# EAGLE design LocoNet-DCC Interface v3.0 (EAGLE 9.6.2)
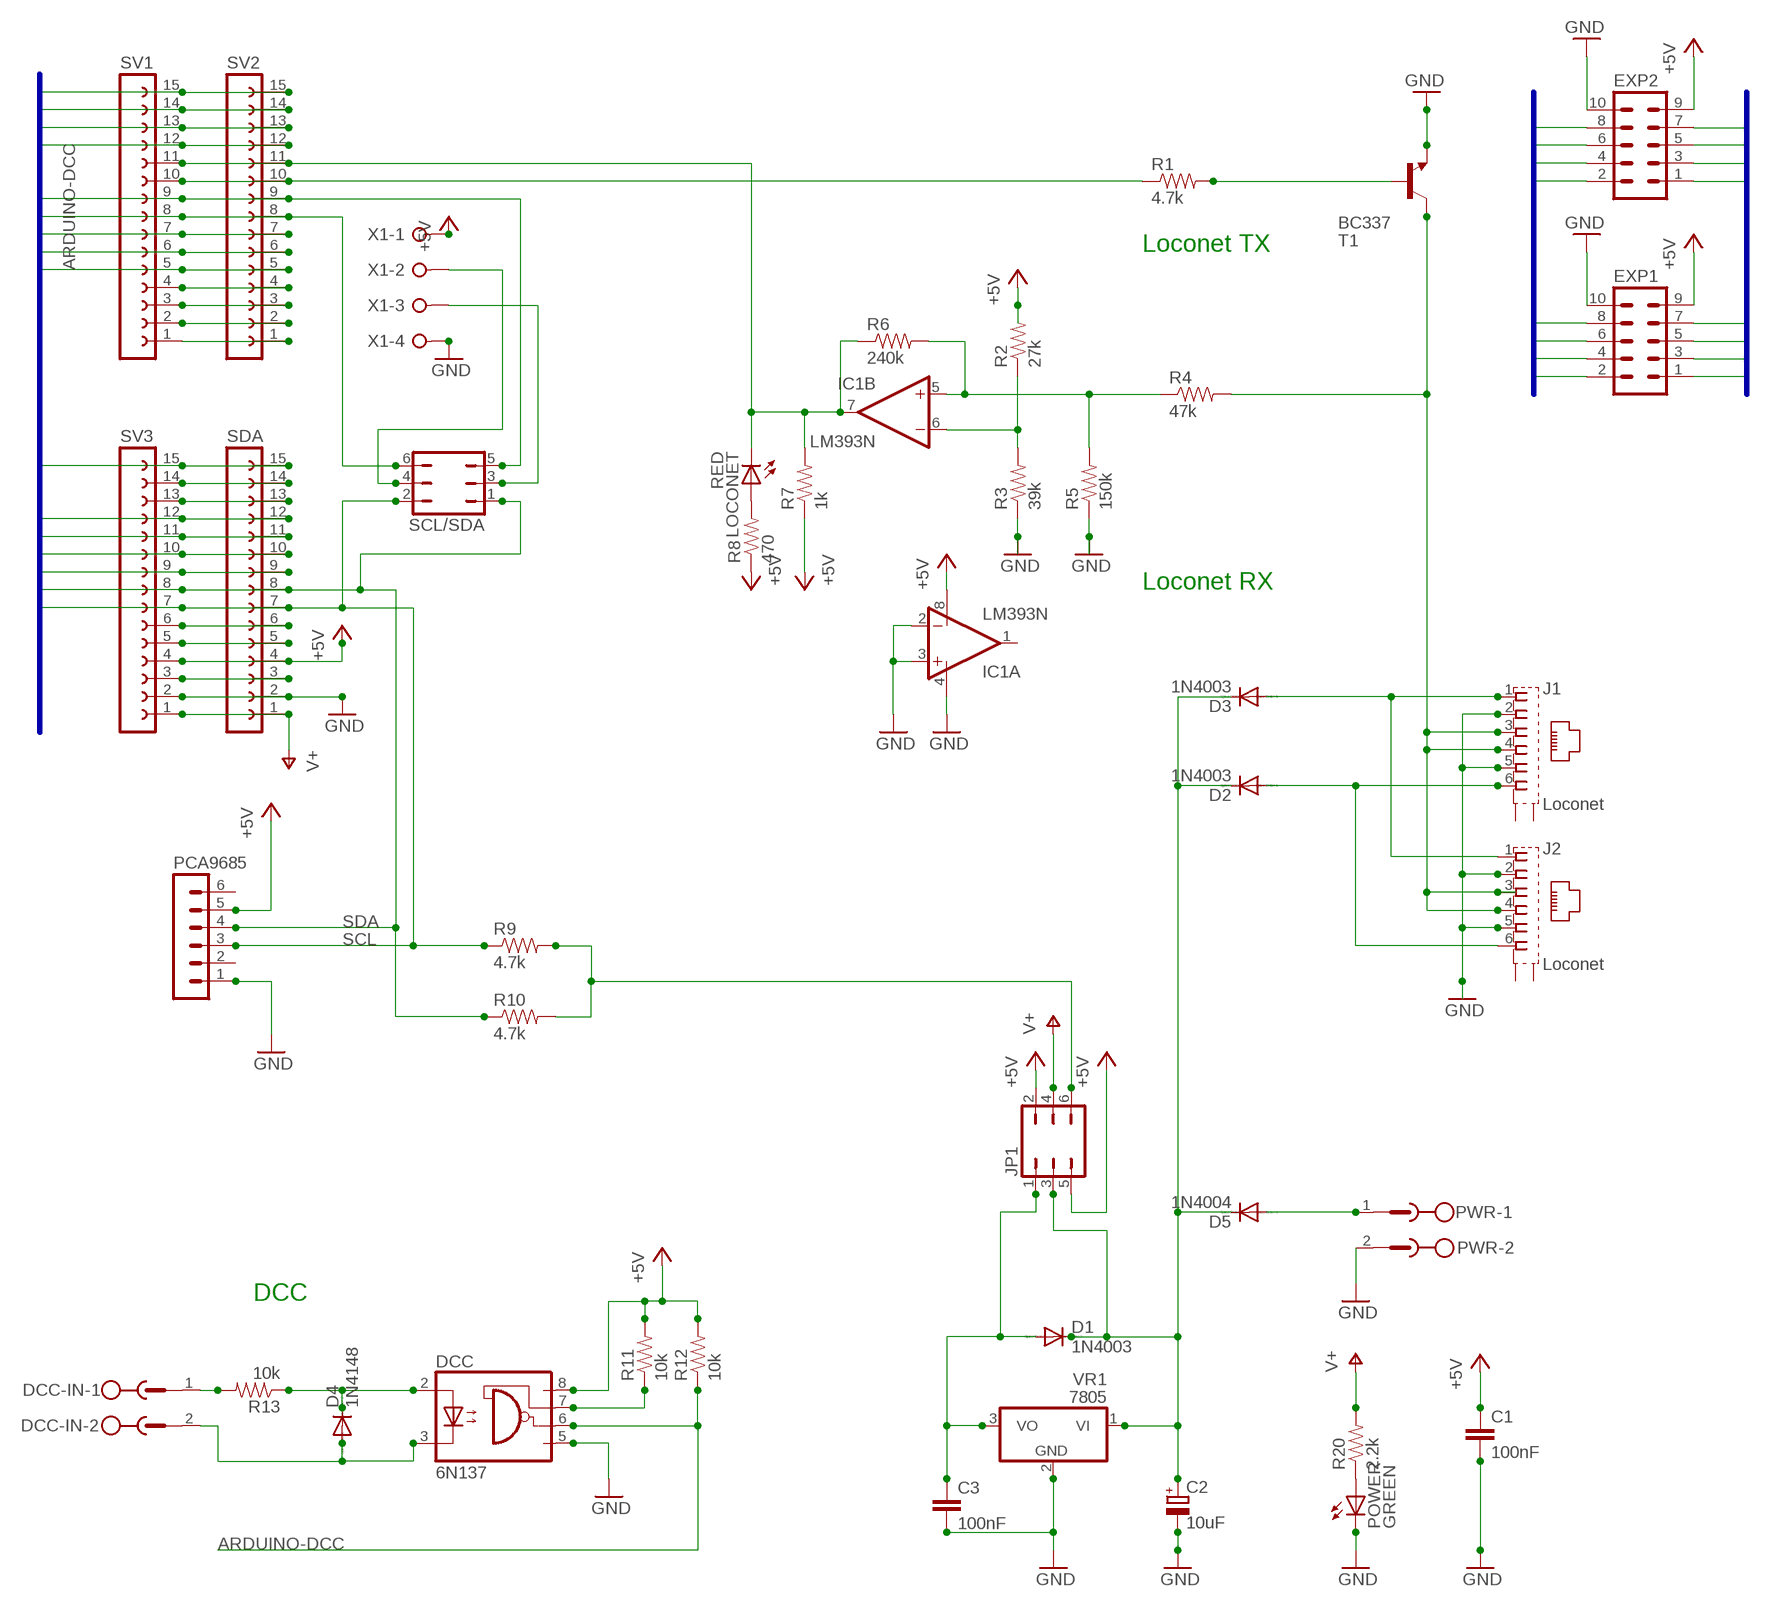
[diagram p0: schematic, sheet 1]

## Parts
C1  100nF  C-EU025_050-025X075  [C025_050-025X075]
C2  10uF  CPOL-EUE2.5-6  [E2,5-6]
C3  100nF  C-EU025_050-025X075  [C025_050-025X075]
D1  1N4003  1N4004  [DO41-10]
D2  1N4003  1N4004  [DO41-10]
D3  1N4003  1N4004  [DO41-10]
D4  1N4148  1N4148DO35-7  [DO35-7]
D5  1N4004  [DO41-10]
DCC  6N137  [DIL08]
DCC-IN  2EDG-02  [2EDG-02]
EXP1  ML10  [ML10]
EXP2  ML10  [ML10]
IC1  LM393N  [DIL08]
J1  Loconet  555140-1  [555140-1]
J2  Loconet  555140-1  [555140-1]
JP1  JP3Q  [JP3Q]
LOCONET  RED  LED3MM  [LED3MM]
PCA9685  MA06-1  [MA06-1]
POWER  GREEN  LED3MM  [LED3MM]
PWR  2EDG-02  [2EDG-02]
R1  4.7k  RESISTORAXIAL-0.3  [AXIAL-0.3]
R2  27k  RESISTORAXIAL-0.3  [AXIAL-0.3]
R3  39k  RESISTORAXIAL-0.3  [AXIAL-0.3]
R4  47k  RESISTORAXIAL-0.3  [AXIAL-0.3]
R5  150k  RESISTORAXIAL-0.3  [AXIAL-0.3]
R6  240k  RESISTORAXIAL-0.3  [AXIAL-0.3]
R7  1k  RESISTORAXIAL-0.3  [AXIAL-0.3]
R8  470  RESISTORAXIAL-0.3  [AXIAL-0.3]
R9  4.7k  RESISTORAXIAL-0.3  [AXIAL-0.3]
R10  4.7k  RESISTORAXIAL-0.3  [AXIAL-0.3]
R11  10k  RESISTORAXIAL-0.3  [AXIAL-0.3]
R12  10k  RESISTORAXIAL-0.3  [AXIAL-0.3]
R13  10k  RESISTORAXIAL-0.3  [AXIAL-0.3]
R20  2.2k  RESISTORAXIAL-0.3  [AXIAL-0.3]
SCL/SDA  JP3Q  [JP3Q]
SDA  FE15-1NOTEXT  [FE15]
SV1  FE15-1NOTEXT  [FE15]
SV2  FE15-1NOTEXT  [FE15]
SV3  FE15-1NOTEXT  [FE15]
T1  BC337  [TO92]
VR1  7805  7805TV  [TO220V]
X1  W237-04P  [W237-4P]

## Nets
3V3: SDA.14 SV3.14
+5V [5v]: C1.1 DCC.8(VCC) EXP1.9 EXP2.9 IC1.8(P:V+) JP1.2 JP1.5 PCA9685.5 R2.P$2 R7.P$1 R8.P$1 R11.P$2 R12.P$2 SDA.4 SV3.4 X1.1
A0: EXP2.3 SDA.12 SV3.12
A1: EXP2.4 SDA.11 SV3.11
A2: EXP2.5 SDA.10 SV3.10
A3: EXP2.6 SDA.9 SV3.9
A6: SDA.6 SV3.6
A7: SDA.5 SV3.5
ARDUINO-DCC: DCC.6(VO) EXP1.1 R12.P$1 SV1.5 SV2.5
AREF: SDA.13 SV3.13
GND [ground]: C1.2 C2.- C3.2 DCC.5(GND) EXP1.10 EXP2.10 IC1.2(A:-IN) IC1.3(A:+IN) IC1.4(P:V-) J1.2 J1.5 J2.2 J2.5 PCA9685.1 POWER.K(C) PWR.2 R3.P$1 R5.P$1 SDA.2 SV3.2 T1.1(E) VR1.2(GND) X1.4
I2C_PULLUP: JP1.6 R9.P$2 R10.P$2
L-RX: IC1.7(B:OUT) LOCONET.K(C) R6.P$1 R7.P$2 SV1.11 SV2.11
L-TX: R1.P$1 SV1.10 SV2.10
LOCONET-SIGNAL [Loconet]: J1.3 J1.4 J2.3 J2.4 R4.P$2 T1.3(C)
N$5: POWER.A R20.P$1
N$7: LOCONET.A R8.P$2
N$8: R1.P$2 T1.2(B)
N$10: IC1.6(B:-IN) R2.P$1 R3.P$2
N$11: IC1.5(B:+IN) R4.P$1 R5.P$2 R6.P$2
N$14: SDA.3 SV3.3
N$30: SV1.4 SV2.4
N$37 [DCC]: D4.C DCC.2(A) R13.P$1
N$42 [DCC]: D4.A DCC-IN.2 DCC.3(C)
N$43: DCC.7(VE) R11.P$1
N$45 [DCC]: DCC-IN.1 R13.P$2
PIN3: EXP1.2 SV1.6 SV2.6
PIN4: EXP1.3 SV1.7 SV2.7
PIN5: EXP1.4 SCL/SDA.6 SV1.8 SV2.8
PIN6: EXP1.5 SCL/SDA.5 SV1.9 SV2.9
PIN9: EXP1.6 SV1.12 SV2.12
PIN10: EXP1.7 SV1.13 SV2.13
PIN11: EXP1.8 SV1.14 SV2.14
PIN12: EXP2.1 SV1.15 SV2.15
PIN13: EXP2.2 SDA.15 SV3.15
PWR-IN [Vin]: D5.A PWR.1
RAILSYNC-A [Vin]: D3.A J1.1 J2.1
RAILSYNC-B [Vin]: D2.A J1.6 J2.6
RAILSYNC-VIN [Vin]: C2.+ D1.C D2.C D3.C D5.C JP1.3 VR1.1(VI)
RESET: SV1.3 SV2.3
RXD: SV1.2 SV2.2
SCL: EXP2.8 PCA9685.3 R9.P$1 SCL/SDA.2 SDA.7 SV3.7
SDA: EXP2.7 PCA9685.4 R10.P$1 SCL/SDA.1 SDA.8 SV3.8
TXD: SV1.1 SV2.1
V-OUT [5v]: C3.1 D1.A JP1.1 VR1.3(VO)
VIN [Vin]: JP1.4 R20.P$2 SDA.1 SV3.1 ; supply symbol labelled V+
X1-SCL/D5: SCL/SDA.4 X1.2
X1-SDA/D6: SCL/SDA.3 X1.3
Unconnected: IC1.1(A:OUT) J1.G1(S1) J1.G2(S2) J2.G1(S1) J2.G2(S2) PCA9685.2 PCA9685.6

## Buses
EXPANSION:A0,A1,A2,A3,ARDUINO-DCC,PIN3,PIN4,PIN5,PIN6,PIN9,PIN10,PIN11,PIN12,PIN13,SCL,SDA

## Notes on the sheet
- Loconet TX
- Loconet RX
- DCC

## Library data of the parts
C1 C3 = rcl:C-EU: CAPACITOR, European symbol
C2 = rcl:CPOL-EU: POLARIZED CAPACITOR, European symbol
D1-D3 D5 = diode:1N4004: DIODE general purpose rectifier, 1 A
D4 = diode:1N4148: DIODE high speed (Philips)
DCC = optocoupler:6N137: MOTOROLA OPTO COUPLER; MPN: 6N137; OC_FARNELL: 1328376; OC_NEWARK: 52M1895
DCC-IN PWR = 2EDG Connectors 5.08mm - Full Silkscreen on PCB v1-0:2EDG-02: 2EDG Connectors Rembrandt Electronics
EXP1 EXP2 = con-ml:ML10: HARTING; OC_FARNELL: unknown; OC_NEWARK: unknown
IC1 = linear:LM393: COMPARATOR
J1 J2 = con-amp:555140-1: AMP connector
JP1 SCL/SDA = jumper:JP3Q: JUMPER
LOCONET POWER = led:LED: LED OSRAM: - CHIPLED LG R971, LG N971, LY N971, LG Q971, LY Q971, LO R971, LY R971 LH N974, LH R974 LS Q976, LO Q976, LY Q976 LO Q996 - Hyper CHIPLED LW Q18S LB Q993, LB Q99A, LB R99A - SideLED LS A670, LO A670, LY A670, LG A670, LP A670 LB A673, LV A673, LT A673, LW A673 LH A674 LY A675 LS A676, LA A676, LO A676, LY A676, LW A676 LS A679, LY A679, LG A679 - Hyper Micro SIDELED® LS Y876, LA Y876, LO Y876, LY Y876 LT Y87S - SmartLED LW L88C, LW L88S LB L89C, LB L89S, LG L890 LS L89K, LO L89K, LY L89K LS L896, LA L896, LO L896, LY L896 - TOPLED LS T670, LO T670, LY T670, LG T670, LP T670 LSG T670, LSP T670, LSY T670, LOP T670, LYG T670 LG T671, LOG T671, LSG T671 LB T673, LV T673, LT T673, LW T673 LH T674 LS T676, LA T676, LO T676, LY T676, LB T676, LH T676, LSB T676, LW T676 LB T67C, LV T67C, LT T67C, LS T67K, LO T67K, LY T67K, LW E67C LS E67B, LA E67B, LO E67B, LY E67B, LB E67C, LV E67C, LT E67C LW T67C LS T679, LY T679, LG T679 LS T770, LO T770, LY T770, LG T770, LP T770 LB T773, LV T773, LT T773, LW T773 LH T774 LS E675, LA E675, LY E675, LS T675 LS T776, LA T776, LO T776, LY T776, LB T776 LHGB T686 LT T68C, LB T68C - Hyper Mini TOPLED® LB M676 - Mini TOPLED Santana® LG M470 LS M47K, LO M47K, LY M47K Source: http://www.osram.convergy.de LUXEON: - LUMILED® LXK2-PW12-R00, LXK2-PW12-S00, LXK2-PW14-U00, LXK2-PW14-V00 LXK2-PM12-R00, LXK2-PM12-S00, LXK2-PM14-U00 LXK2-PE12-Q00, LXK2-PE12-R00, LXK2-PE12-S00, LXK2-PE14-T00, LXK2-PE14-U00 LXK2-PB12-K00, LXK2-PB12-L00, LXK2-PB12-M00, LXK2-PB14-N00, LXK2-PB14-P00, LXK2-PB14-Q00 LXK2-PR12-L00, LXK2-PR12-M00, LXK2-PR14-Q00, LXK2-PR14-R00 LXK2-PD12-Q00, LXK2-PD12-R00, LXK2-PD12-S00 LXK2-PH12-R00, LXK2-PH12-S00 LXK2-PL12-P00, LXK2-PL12-Q00, LXK2-PL12-R00 Source: www.luxeon.com KINGBRIGHT: KA-3528ASYC Source: www.kingbright.com
PCA9685 = con-lstb:MA06-1: PIN HEADER; OC_FARNELL: unknown; OC_NEWARK: unknown
R1-R13 R20 = SparkFun-Resistors:RESISTOR: Resistor Basic schematic elements and footprints for 0603, 1206, and PTH resistors.
SDA SV1-SV3 = con-lsta:FE15-1: FEMALE HEADER
T1 = transistor:BC337: NPN TRANSISTOR
VR1 = linear:78*: Positive VOLTAGE REGULATOR Source: http://cache.national.com/ds/LM/LM78L05.pdf http://www.fairchildsemi.com/ds/LM/LM7805.pdf
X1 = con-wago-508:W237-04P: WAGO SREW CLAMP; OC_FARNELL: unknown; OC_NEWARK: unknown

## Net classes
0 default: width 0.254 mm
1 ground: width 0.61 mm
2 5v: width 0.508 mm
3 Vin: width 0.61 mm
4 Loconet: width 0.508 mm
5 DCC: width 0.508 mm

## Board
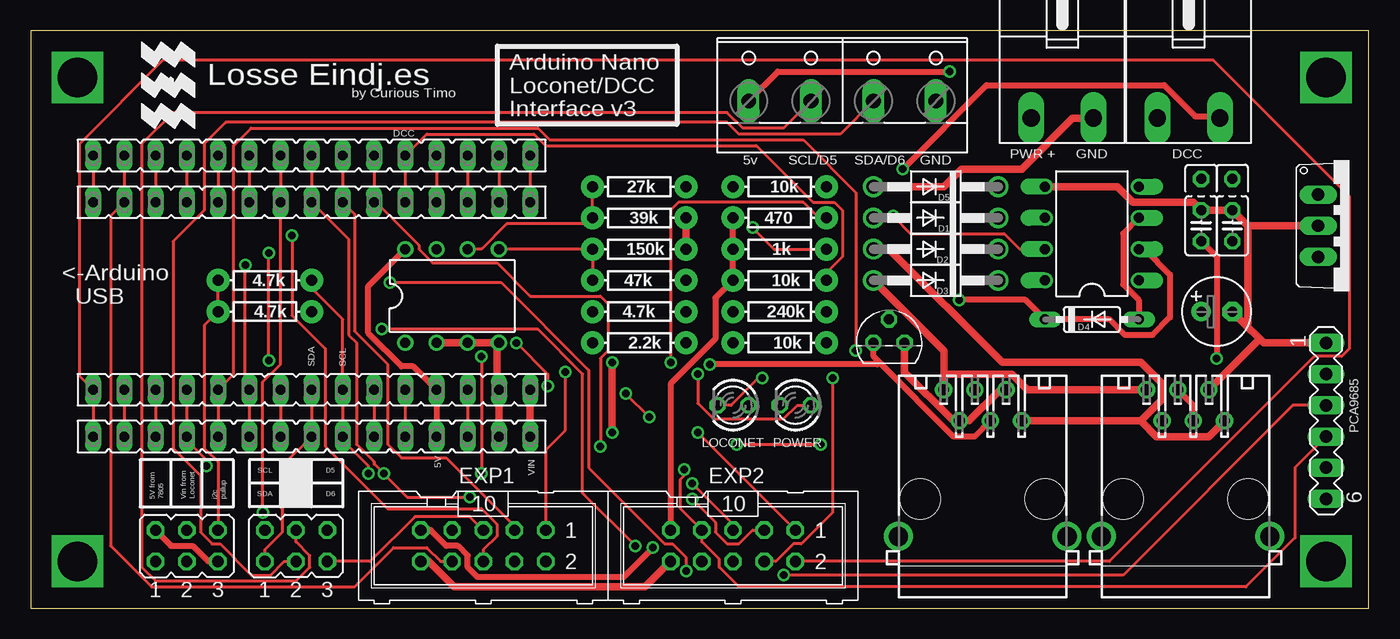
[diagram p1: board, top side]
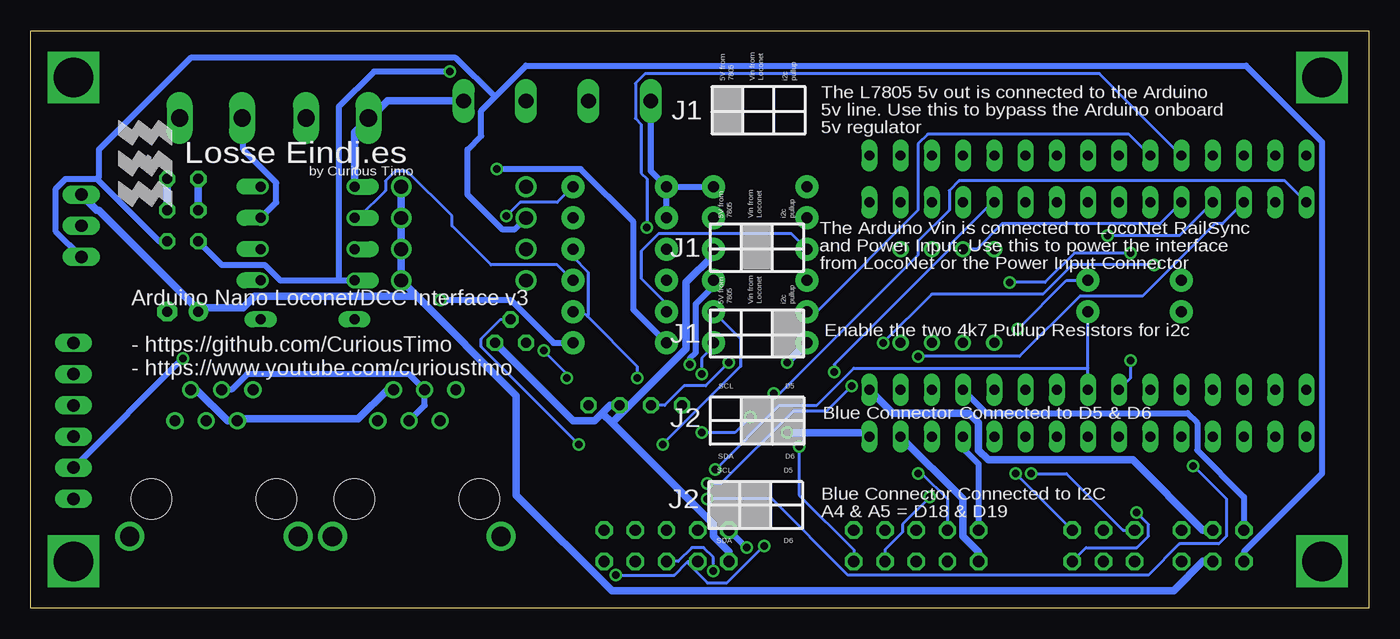
[diagram p2: board, bottom side, seen from below]

Size 108.89 x 46.98 mm. Coordinates in mm from the lower left corner, seen from the top.
Outline: 0,0 108.89,0 108.89,46.98 0,46.98 0,0
Copper layers (1*16): Top 0.035mm / dielectric 1.5mm / Bottom 0.035mm
Design rules "default": minimum track width 10mil, minimum drill 24mil, track to track 8mil, track to pad 8mil, pad to pad 8mil, via to via 8mil, smd to smd 8mil, copper to edge 40mil, drill to drill 8mil, minimum pad ring 10mil, minimum via ring 8mil, stop-mask expansion 4mil, vias tented up to drill 0mil, thermal gap 10mil

### Footprints (pad centres in the part's own frame; a part is rotated, then mirrored left to right if it is on the bottom)
C025_050-025X075 = drill 0.813 octagon: 1 -1.27,0; 2 1.27,0; 3 3.81,0
E2,5-6 = drill 0.813 pad 1.6: + -1.27,0 | drill 0.813 pad 1.6 octagon: - 1.27,0
DO41-10 = drill 1.118: A 5.08,0; C -5.08,0
DO35-7 = drill 0.813 long: A 3.81,0; C -3.81,0
DIL08 = drill 0.813 offset: 1 -3.81,-3.81; 2 -1.27,-3.81; 3 1.27,-3.81; 4 3.81,-3.81; 5 3.81,3.81; 6 1.27,3.81; 7 -1.27,3.81; 8 -3.81,3.81
2EDG-02 = drill 1.397 long: 1 -2.54,7.62; 2 2.54,7.62
ML10 = drill 0.914 octagon: 1 -5.08,-1.27; 2 -5.08,1.27; 3 -2.54,-1.27; 4 -2.54,1.27; 5 0,-1.27; 6 0,1.27; 7 2.54,-1.27; 8 2.54,1.27; 9 5.08,-1.27; 10 5.08,1.27
DIL08' = drill 0.813 pad 1.27: 1 -3.81,-3.81; 2 -1.27,-3.81; 3 1.27,-3.81; 4 3.81,-3.81; 5 3.81,3.81; 6 1.27,3.81; 7 -1.27,3.81; 8 -3.81,3.81
555140-1 = drill 0.889: 1 -3.175,8.89; 2 -1.905,6.35; 3 -0.635,8.89; 4 0.635,6.35; 5 1.905,8.89; 6 3.175,6.35 | drill 1.575 pad 2.184: G1 -6.858,-3.048; G2 6.858,-3.048 | hole 3.251: -5.08,0; 5.08,0
JP3Q = drill 0.914 octagon: 1 -2.54,-1.27; 2 -2.54,1.27; 3 0,-1.27; 4 0,1.27; 5 2.54,-1.27; 6 2.54,1.27
LED3MM = drill 0.813 octagon: A -1.27,0; K 1.27,0
MA06-1 = drill 1.016 long: 1 -6.35,0; 2 -3.81,0; 3 -1.27,0; 4 1.27,0; 5 3.81,0; 6 6.35,0
AXIAL-0.3 = drill 0.9 pad 1.88: P$1 -3.81,0; P$2 3.81,0
FE15 = drill 0.813 long: 1 -17.78,0; 2 -15.24,0; 3 -12.7,0; 4 -10.16,0; 5 -7.62,0; 6 -5.08,0; 7 -2.54,0; 8 0,0; 9 2.54,0; 10 5.08,0; 11 7.62,0; 12 10.16,0; 13 12.7,0; 14 15.24,0; 15 17.78,0
TO92 = drill 0.813 octagon: 1 1.27,0; 2 0,1.905; 3 -1.27,0
TO220V = drill 1.016 long: 1 -2.54,-2.54; 2 0,-2.54; 3 2.54,-2.54
W237-4P = drill 1.194 long: 1 -7.62,-0.635; 2 -2.54,-0.635; 3 2.54,-0.635; 4 7.62,-0.635

### Placement (x,y rotation side)
C1  95.25,31.12 90 top
C2  96.52,24.13 0 top
C3  97.79,31.12 90 top
D1  73.66,31.75 180 top
D2  73.66,29.21 180 top
D3  73.66,26.67 180 top
D4  86.36,23.49 0 top
D5  73.66,34.29 180 top
DCC  86.36,30.48 90 top
DCC-IN  94.23,47.5 180 top
EXP1  36.83,5.08 180 top
EXP2  57.15,5.08 180 top
IC1  LM393N  [DIL08']  34.29,25.4 0 top
J1  77.47,8.89 0 top
J2  93.98,8.89 0 top
JP1  12.7,5.08 0 top
LOCONET  57.15,16.51 180 top
PCA9685  105.41,15.24 270 top
POWER  62.23,16.51 180 top
PWR  83.95,47.5 180 top
R1  49.53,24.13 0 top
R2  49.53,34.29 0 top
R3  49.53,31.75 180 top
R4  49.53,26.67 0 top
R5  49.53,29.21 180 top
R6  60.96,24.13 180 top
R7  60.96,29.21 0 top
R8  60.96,31.75 0 top
R9  19.05,26.67 180 top
R10  19.05,24.13 180 top
R11  60.96,34.29 180 top
R12  60.96,26.67 180 top
R13  60.96,21.59 180 top
R20  49.53,21.59 180 top
SCL/SDA  21.59,5.08 0 top
SDA  22.86,13.97 180 top
SV1  22.86,36.83 180 top
SV2  22.86,33.02 180 top
SV3  22.86,17.78 180 top
T1  69.85,21.59 0 top
VR1  107.31,31.12 270 top
X1  66.04,41.91 0 top

### Tracks (layer width: path | path; a pad name or v marks a point on that pad's centre or on a via)
3V3
  Top 0.254: SV3.14 SDA.14
+5V  (via drill 0.61)
  Top 0.508: JP1.5 14.45,3.81 13.18,5.08 11.43,5.08 JP1.2 | SDA.4 SV3.4 31.11,19.68 30.16,19.68 27.46,22.38 27.46,26.19 IC1.8 | v96.52,20.32 96.52,28.57 C1.1 | EXP2.9 52.07,18.26 55.72,21.91 55.72,25.24 R12.P$2 R7.P$1 R8.P$1 | v74.77,43.66 60.8,43.66 X1.1 | EXP1.9 32.54,6.35 33.81,5.08 34.77,5.08 35.56,4.29 35.56,3.33 36.35,2.54 48.26,2.54 v50.64,4.92
  Bottom 0.508: EXP1.9 31.75,11.75 33.02,13.02 SDA.4 | JP1.2 10.16,9.05 13.97,12.86 13.97,15.08 14.76,15.88 31.11,15.88 SV3.4 | 83.82,26.67 88.58,26.67 89.85,27.94 93.34,27.94 C1.1 | 83.82,26.67 DCC.8 | v96.52,20.32 PCA9685.5 | X1.1 58.42,35.56 R11.P$2 | R11.P$2 R2.P$2 | R8.P$1 R11.P$2 | EXP2.9 v50.64,4.92 | 83.82,26.67 83.82,40.8 80.96,43.66 v74.77,43.66
A0  (via drill 0.61)
  Top 0.254: SV3.12 SDA.12 12.7,13.65 14.29,12.06 v14.29,11.59 | EXP2.3 58.74,6.35 57.63,5.24 56.67,5.24 55.72,6.19 55.72,6.98 v53.82,8.89
  Bottom 0.254: v53.82,8.89 48.58,8.89 42.39,2.7 17.94,2.7 15.4,5.24 12.22,5.24 11.59,5.87 11.59,8.89 v14.29,11.59
A1  (via drill 0.61)
  Top 0.254: SDA.11 SV3.11 16.51,19.05 16.51,37.62 17.94,39.05 41.28,39.05 42.23,38.1 62.87,38.1 67.15,33.81 v67.15,20.95 | EXP2.4 60.64,3.81 62.07,5.24 62.71,5.24 65.25,7.78 v65.25,18.73
  Bottom 0.254: v65.25,18.73 65.25,19.05 v67.15,20.95
A2  (via drill 0.61)
  Top 0.254: 17.78,17.62 SDA.10 | EXP2.5 57.15,6.83 v53.82,10.16 | v42.07,18.1 42.07,19.05 v39.53,21.59 | v17.46,27.94 17.46,17.94 17.78,17.62 | 17.78,17.62 SV3.10
  Bottom 0.254: v53.82,10.16 52.71,10.16 46.83,16.03 44.13,16.03 v42.07,18.1 | v39.53,21.59 35.56,25.56 26.51,25.56 24.13,27.94 v17.46,27.94
A3  (via drill 0.61)
  Top 0.254: SV3.9 SDA.9 | v53.34,3.02 53.34,4.13 52.23,5.24 51.59,5.24 45.4,11.43 45.4,19.37 38.26,26.51 v29.21,26.51 | v19.37,20.16 v19.37,28.89
  Bottom 0.254: EXP2.6 56.2,3.81 55.09,4.92 54.13,4.92 53.34,4.13 v53.34,3.02 | v29.21,26.51 26.35,26.51 23.97,28.89 v19.37,28.89 | v19.37,20.16 19.37,18.73 SV3.9
A6
  Top 0.254: SV3.6 SDA.6
A7
  Top 0.254: SV3.5 SDA.5
ARDUINO-DCC  (via drill 0.61)
  Top 0.254: SV2.5 SV1.5 32.23,38.58 40.96,38.58 41.91,37.62 59.05,37.62 63.66,33.02 65.41,33.02 66.04,32.38 66.04,28.57 64.77,27.3 R12.P$1 | EXP1.1 41.91,12.86 43.5,14.45 v43.5,19.21
  Bottom 0.254: DCC.6 82.23,31.75 80.01,33.97 80.01,34.77 79.22,35.56 78.26,35.56 74.61,31.91 74.61,31.12 71.44,27.94 66.04,27.94 R12.P$1 | v43.5,19.21 43.5,19.84 34.13,29.21 34.13,29.53 30.64,33.02 SV2.5
AREF
  Top 0.254: SV3.13 SDA.13
GND
  Top 0.61: 99.06,31.12 VR1.2 | 99.06,31.12 C3.2 C1.2 94.61,33.02 89.69,33.02 88.42,34.29 DCC.5 | PCA9685.1 100.33,21.59 100.01,21.91 | C2.- 98.9,23.02 | 98.9,23.02 100.01,21.91 | 100.01,21.91 J2.5 | 99.06,31.12 99.06,23.18 98.9,23.02 | IC1.2 IC1.3 IC1.4 37.94,21.43 37.94,17.94 SV3.2 SDA.2 | J1.5 78.9,17.78 76.36,15.24 J1.2 75.41,15.4 74.93,15.4 71.12,19.21 T1.1 | R3.P$1 R5.P$1 | EXP1.10 32.38,3.81 34.45,1.75 50.01,1.75 EXP2.10
  Bottom 0.61: J2.5 95.41,17.78 92.87,15.24 J2.2 91.92,15.4 82.23,15.4 79.85,17.78 J1.5 | EXP1.10 31.75,4.6 33.02,5.87 33.02,8.89 SDA.2 | POWER.K 61.75,16.51 62.39,15.88 | 62.39,15.88 63.02,15.24 64.77,15.24 T1.1 | EXP2.10 52.07,4.6 53.34,5.87 53.34,6.83 61.6,15.08 | 62.39,15.88 61.6,15.08 | R5.P$1 53.34,28.73 55.56,26.51 55.56,21.11 61.6,15.08 | DCC.5 82.55,38.73 PWR.2 81.12,40.01 79.85,41.27 X1.4
I2C_PULLUP
  Top 0.254: JP1.6 15.24,11.91 14.13,13.02 14.13,23.02 R10.P$2 R9.P$2
L-RX  (via drill 0.61)
  Top 0.254: LOCONET.K 56.99,16.51 59.21,18.73 v59.53,18.73 | SV1.11 SV2.11 | R7.P$2 60.48,29.21 v58.74,30.96
  Bottom 0.254: v59.53,18.73 59.53,19.68 63.58,23.73 | 63.58,23.73 63.98,24.13 R6.P$1 | R7.P$2 64.77,28.57 63.5,27.3 63.5,23.81 63.58,23.73 | IC1.7 31.91,29.21 29.84,31.27 16.99,31.27 SV2.11 | v58.74,30.96 58.74,34.92 59.21,35.4 59.21,39.37 59.69,39.85 59.69,42.7 58.9,43.5 21.91,43.5 SV1.11
L-TX
  Top 0.254: SV1.10 SV2.10
  Bottom 0.254: R1.P$1 44.93,24.13 36.67,32.38 36.67,37.78 35.88,38.58 19.53,38.58 SV1.10
LOCONET-SIGNAL  (via drill 0.61)
  Top 0.508: J2.4 94.61,16.51 J2.3 | T1.3 68.58,20.48 69.06,20 | 69.06,20 75.09,13.97 76.83,13.97 J1.4 | v55.25,19.84 68.9,19.84 69.06,20
  Bottom 0.508: J1.4 76.83,16.51 J1.3 78.1,19.05 91.28,19.05 92.55,17.78 J2.3 | R4.P$2 53.34,26.19 54.77,24.76 54.77,20.8 55.25,20.32 v55.25,19.84
N$2  (via drill 3.2 pad 3.81)
  other vias: 105.41,43.18
N$3  (via drill 3.2 pad 3.81)
  other vias: 105.41,3.81
N$4  (via drill 3.2 pad 3.81)
  other vias: 3.81,3.81
N$5  (via drill 0.61)
  Top 0.254: POWER.A 62.39,16.51 61.28,15.4 55.56,15.4 54.29,16.67 v54.29,19.05
  Bottom 0.254: v54.29,19.05 54.29,20.32 53.34,21.27 R20.P$1
N$6  (via drill 3.2 pad 3.81)
  other vias: 3.81,43.18
N$7  (via drill 0.61)
  Top 0.254: v52.07,20 52.07,32.38 52.71,33.02 62.87,33.02 64.14,31.75 R8.P$2
  Bottom 0.254: LOCONET.A 57.31,16.51 55.72,18.1 53.98,18.1 v52.07,20
N$8  (via drill 0.61)
  Top 0.254: v57.47,13.33 v64.29,13.33
  Bottom 0.254: T1.2 70.64,23.49 72.23,21.91 72.23,21.27 v64.29,13.33 | v57.47,13.33 51.12,19.68 51.12,21.91 R1.P$2
N$10
  Top 0.254: IC1.6 36.67,29.21 38.74,31.27 45.24,31.27 R3.P$2 R2.P$1
N$11
  Top 0.254: IC1.5 R5.P$2 R4.P$1
  Bottom 0.254: R6.P$2 57.15,24.76 59.21,26.83 59.21,29.05 57.79,30.48 46.99,30.48 R5.P$2
N$14
  Top 0.254: SV3.3 SDA.3
N$30
  Top 0.254: SV1.4 SV2.4
N$37  (via drill 0.61)
  Top 0.508: DCC.2 90.65,29.21 92.71,27.15 92.71,23.65 91.28,22.22 89.06,22.22 87.79,23.49 D4.C 80.96,25.08 v75.56,25.08
  Bottom 0.508: R13.P$1 66.36,21.59 69.85,25.08 v75.56,25.08
N$42
  Top 0.508: D4.A 90.17,25.08 88.9,26.35 88.9,30.48 DCC.3
  Bottom 0.508: DCC.3 88.9,33.02 88.9,34.61 91.6,37.31 91.6,39.85 DCC-IN.2
N$43  (via drill 0.61)
  Top 0.254: DCC.7 80.49,29.21 79.22,30.48 71.6,30.48 v70.17,31.91
  Bottom 0.254: v70.17,31.91 69.06,33.02 66.04,33.02 R11.P$1
N$45  (via drill 0.61)
  Top 0.508: v70.96,35.72 77.79,42.54 92.23,42.54 94.77,40.01 96.68,40.01 DCC-IN.1
  Bottom 0.508: v70.96,35.72 64.14,35.72 59.85,31.43 59.85,24.29 R13.P$2
PIN3  (via drill 0.61)
  Top 0.254: SV1.6 27.94,33.18 | v46.36,13.18 46.36,20.32 46.99,20.95 46.99,24.76 46.36,25.4 40.64,25.4 37.94,28.1 32.7,28.1 31.59,29.21 31.59,29.53 27.94,33.18 | 27.94,33.18 SV2.6
  Bottom 0.254: EXP1.2 41.91,4.76 46.36,9.21 v46.36,13.18
PIN4
  Top 0.254: SV1.7 SV2.7 26.35,32.07 26.35,22.54 29.05,19.84 29.05,13.33 30.16,12.22 33.81,12.22 39.37,6.67 EXP1.3
PIN5  (via drill 0.61)
  Top 0.254: SV1.8 SV2.8 25.88,30 25.88,22.22 26.51,21.59 26.51,13.33 27.94,11.91 27.94,11.75 v28.73,10.95 30.64,9.05 v35.72,9.05
  Bottom 0.254: v28.73,10.95 SCL/SDA.6 | EXP1.4 39.37,4.76 37.94,6.19 37.94,6.83 v35.72,9.05
PIN6  (via drill 0.61)
  Top 0.254: SV1.9 SV2.9 20.32,19.84 18.89,18.41 v18.89,7.78 | SCL/SDA.5 27.62,3.81 31.27,7.46 35.72,7.46 EXP1.5
  Bottom 0.254: v18.89,7.78 17.94,6.83 17.94,5.87 18.89,4.92 23.02,4.92 SCL/SDA.5
PIN9  (via drill 0.61)
  Top 0.254: SV1.12 SV2.12 | EXP1.6 36.83,4.76 37.94,5.87 37.94,6.83 36.67,8.1 29.05,8.1 23.97,13.18 23.97,21.11 21.27,23.81 v21.27,30.32
  Bottom 0.254: v21.27,30.32 15.4,30.32 SV2.12
PIN10  (via drill 0.61)
  Top 0.254: SV1.13 SV2.13 | v36.67,20.48 v36.67,10.95
  Bottom 0.254: EXP1.7 34.29,8.89 36.35,10.95 v36.67,10.95 | v36.67,20.48 28.42,20.48 23.5,25.4 18.41,25.4 12.54,31.27 11.91,31.27 SV2.13
PIN11
  Top 0.254: SV1.14 SV2.14 6.51,31.91 6.51,5.08 9.84,1.75 26.35,1.75 29.53,4.92 32.23,4.92 33.34,3.81 EXP1.8
PIN12  (via drill 0.61)
  Top 0.254: SV1.15 SV2.15 | v54.29,14.29 EXP2.1 | v48.42,17.46 v50.32,15.56
  Bottom 0.254: v54.29,14.29 51.59,14.29 v50.32,15.56 | v48.42,17.46 47.94,17.46 36.67,28.73 36.67,29.84 34.13,32.38 34.13,33.97 33.34,34.77 6.83,34.77 SV2.15
PIN13
  Top 0.254: SDA.15 SV3.15 3.97,18.89 3.97,37.78 10.79,44.61 96.2,44.61 107.31,33.5 107.31,21.11 106.68,20.48 104.46,20.48 87.79,3.81 EXP2.2
PWR-IN
  Top 0.61: D5.A 74.3,34.29 75.72,35.72 80.64,35.72 84.77,39.85 86.36,39.85 PWR.1
RAILSYNC-A
  Top 0.61: 74.3,19.05 74.3,20.95 D3.A | 74.3,19.05 J1.1 | J2.1 81.12,17.78 79.85,19.05 74.3,19.05
RAILSYNC-B
  Top 0.61: 90.33,15.24 J1.6 | 90.33,15.24 91.6,13.97 95.88,13.97 J2.6 | D2.A 69.85,29.21 79.06,20 90.33,20 92.08,18.26 92.08,16.99 90.33,15.24
RAILSYNC-VIN
  Bottom 0.61: VR1.1 103.5,32.38 103.35,32.38 95.25,24.29 C2.+ 95.09,24.45 91.6,24.45 90.65,25.4 77.79,25.4 77.63,25.56 | JP1.3 13.49,3.81 15.88,1.43 61.6,1.43 69.37,9.21 69.37,17.3 77.63,25.56 | 77.63,25.56 D3.C D2.C D1.C D5.C
RESET
  Top 0.254: SV1.3 SV2.3
RXD
  Top 0.254: SV1.2 SV2.2
SCL  (via drill 0.61)
  Top 0.254: v27.46,10.95 27.46,11.59 25.4,13.65 SDA.7 SV3.7 25.4,23.49 22.86,26.03 R9.P$1 | v61.28,2.7 88.9,2.7 102.71,16.51 PCA9685.3 | v28.57,22.7 41.28,22.7 44.93,19.05 44.93,9.37 v49.21,5.08
  Bottom 0.254: SCL/SDA.2 20,6.35 24.61,10.95 v27.46,10.95 | EXP2.8 55.4,3.81 55.48,3.73 | 55.48,3.73 56.52,2.7 v61.28,2.7 | R9.P$1 24.61,26.67 v28.57,22.7 | v49.21,5.08 52.23,2.06 53.82,2.06 55.48,3.73
SDA  (via drill 0.61)
  Top 0.254: SV3.8 SDA.8 20.48,11.59 20.48,6.19 19.05,4.76 SCL/SDA.1 | PCA9685.4 102.87,11.43 102.87,5.71 98.9,1.75 57.63,1.75 56.04,3.33 56.04,3.97 54.61,5.4 EXP2.7 52.86,8.1 52.86,10.48 53.18,10.79 v53.18,11.27
  Bottom 0.254: SV3.8 22.86,19.53 | 22.86,19.53 R10.P$1 | 22.86,19.53 41.91,19.53 44.93,16.51 47.94,16.51 v53.18,11.27
TXD
  Top 0.254: SV1.1 SV2.1
V-OUT
  Bottom 0.508: C3.1 98.42,29.84 103.5,34.92 | 103.5,34.92 106.05,34.92 106.84,34.13 106.84,30.64 VR1.3 | JP1.1 10.16,4.6 3.81,10.95 3.81,37.94 10,44.13 68.58,44.13 71.12,41.59 | 71.12,41.59 72.23,40.48 72.23,38.42 73.34,37.31 73.34,33.65 70.48,30.8 69.53,30.8 D1.A | 71.12,41.59 74.3,44.77 95.88,44.77 103.35,37.31 103.35,35.08 103.5,34.92
VIN  (via drill 0.61)
  Top 0.61: SV3.1 SDA.1 | v47.31,14.29 v47.31,20
  Bottom 0.61: JP1.4 13.49,6.35 19.21,12.06 30.96,12.06 31.75,12.86 31.75,15.08 32.54,15.88 38.74,15.88 SV3.1 | v47.31,20 R20.P$2 | v47.31,14.29 40.96,14.29 SDA.1
X1-SCL/D5
  Top 0.254: SCL/SDA.4 21.59,5.4 22.7,4.29 22.7,3.33 21.59,2.22 10.16,2.22 9.05,3.33 9.05,37.78 11.59,40.32 56.67,40.32 57.94,39.05 61.28,39.05 X1.2
X1-SDA/D6
  Top 0.254: SCL/SDA.3 20.64,3.81 19.53,2.7 17.94,2.7 15.4,5.24 14.76,5.24 13.81,6.19 13.81,10.79 11.59,13.02 11.59,29.84 14.13,32.38 14.13,37.78 15.88,39.53 56.67,39.53 57.63,38.58 65.88,38.58 X1.3

### Text on the board
bPlace: by Curious Timo | Losse Eindj.es | Arduino Nano Loconet/DCC Interface v3 / / - https://github.com/CuriousTimo / - https://www.youtube.com/curioustimo
tNames: Losse Eindj.es | by Curious Timo | Arduino Nano / Loconet/DCC / Interface v3 | DCC | PWR + | GND | DCC | 5v | SCL/D5 | SDA/D6 | GND | <-Arduino / USB | SDA | SCL | SCL | D5 | 5V | VIN | SDA | D6 | 5V from / 7805 | Vin from / Loconet | i2c / pullup
bNames: i2c / pullup | Vin from / Loconet | 5V from / 7805 | J1 | The L7805 5v out is connected to the Arduino / 5v line. Use this to bypass the Arduino onboard / 5v regulator | i2c / pullup | Vin from / Loconet | 5V from / 7805 | J1 | The Arduino Vin is connected to LocoNet RailSync / and Power Input. Use this to power the interface / from LocoNet or the Power Input Connector | i2c / pullup | Vin from / Loconet | 5V from / 7805 | Enable the two 4k7 Pullup Resistors for i2c | J1 | D5 | SCL | Blue Connector Connected to D5 & D6 | J2 | D6 | SDA | D5 | SCL | J2 | Blue Connector Connected to I2C / A4 & A5 = D18 & D19 | D6 | SDA